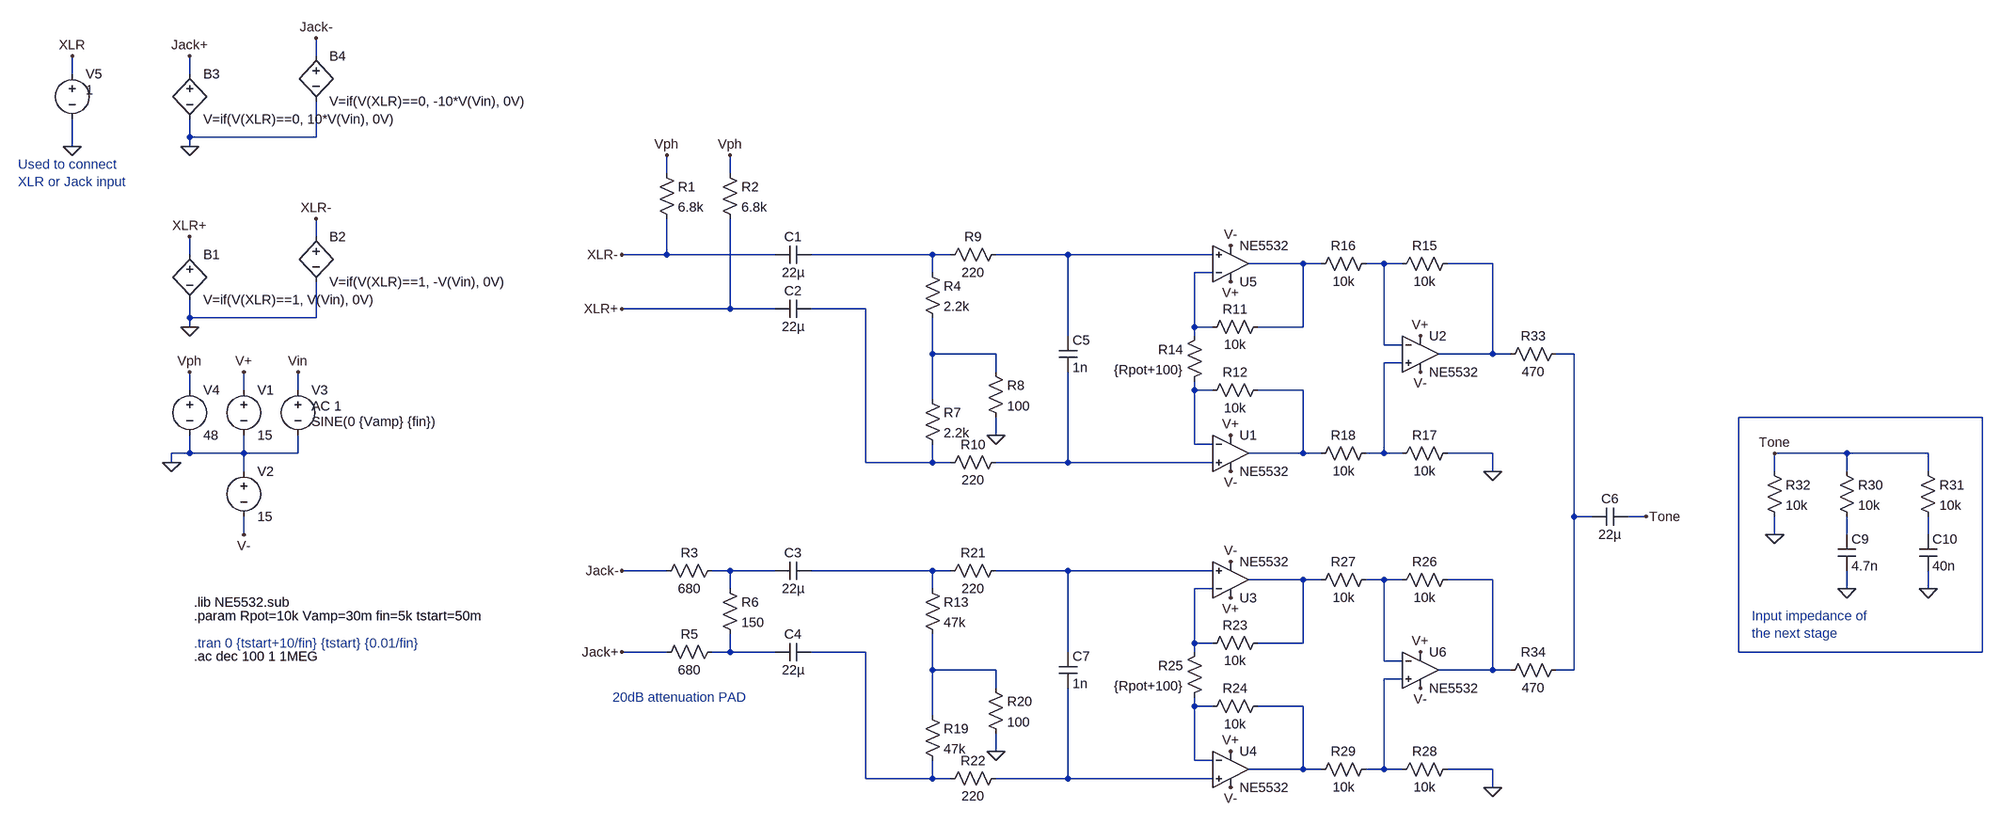
[diagram p0: schematic AudioMixer - Mic-Line-amp.asc]
AudioMixer - Mic-Line-amp.asc, the LTspice schematic file:
Version 4.1
SHEET 1 3588 2084
WIRE -704 -576 -704 -608
WIRE -1136 -544 -1136 -576
WIRE -928 -544 -928 -576
WIRE -928 -432 -928 -464
WIRE -704 -432 -704 -496
WIRE -704 -432 -928 -432
WIRE -1136 -416 -1136 -464
WIRE -928 -416 -928 -432
WIRE 544 -368 544 -400
WIRE 656 -368 656 -400
WIRE -704 -256 -704 -288
WIRE -928 -224 -928 -256
WIRE 544 -224 544 -288
WIRE 544 -224 464 -224
WIRE 736 -224 544 -224
WIRE 1040 -224 800 -224
WIRE 1072 -224 1040 -224
WIRE 1280 -224 1152 -224
WIRE 1536 -224 1280 -224
WIRE 1696 -208 1600 -208
WIRE 1728 -208 1696 -208
WIRE 1840 -208 1808 -208
WIRE 1872 -208 1840 -208
WIRE 2032 -208 1952 -208
WIRE 1040 -192 1040 -224
WIRE 1536 -192 1504 -192
WIRE 656 -128 656 -288
WIRE 656 -128 464 -128
WIRE 736 -128 656 -128
WIRE 896 -128 800 -128
WIRE -928 -112 -928 -144
WIRE -704 -112 -704 -176
WIRE -704 -112 -928 -112
WIRE -928 -96 -928 -112
WIRE 1504 -96 1504 -192
WIRE 1536 -96 1504 -96
WIRE 1696 -96 1696 -208
WIRE 1696 -96 1616 -96
WIRE 1280 -80 1280 -224
WIRE 1504 -80 1504 -96
WIRE 1840 -64 1840 -208
WIRE 1872 -64 1840 -64
WIRE 1040 -48 1040 -112
WIRE 1152 -48 1040 -48
WIRE 2032 -48 2032 -208
WIRE 2032 -48 1936 -48
WIRE 2064 -48 2032 -48
WIRE 2176 -48 2144 -48
WIRE 1872 -32 1840 -32
WIRE 1152 -16 1152 -48
WIRE -928 16 -928 -16
WIRE -832 16 -832 -16
WIRE -736 16 -736 -16
WIRE 1504 16 1504 0
WIRE 1536 16 1504 16
WIRE 1696 16 1616 16
WIRE 1040 32 1040 -48
WIRE 2928 64 2496 64
WIRE 1152 96 1152 64
WIRE 1504 112 1504 16
WIRE 1536 112 1504 112
WIRE -928 128 -928 96
WIRE -928 128 -960 128
WIRE -832 128 -832 96
WIRE -832 128 -928 128
WIRE -736 128 -736 96
WIRE -736 128 -832 128
WIRE 1696 128 1696 16
WIRE 1696 128 1600 128
WIRE 1728 128 1696 128
WIRE 1840 128 1840 -32
WIRE 1840 128 1808 128
WIRE 1872 128 1840 128
WIRE 2032 128 1952 128
WIRE 2688 128 2560 128
WIRE 2832 128 2688 128
WIRE -960 144 -960 128
WIRE 896 144 896 -128
WIRE 1040 144 1040 112
WIRE 1040 144 896 144
WIRE 1072 144 1040 144
WIRE 1280 144 1280 -16
WIRE 1280 144 1152 144
WIRE 1536 144 1280 144
WIRE -832 160 -832 128
WIRE 2032 160 2032 128
WIRE 2560 160 2560 128
WIRE 2688 160 2688 128
WIRE 2832 160 2832 128
WIRE 2176 240 2176 -48
WIRE 2208 240 2176 240
WIRE 2304 240 2272 240
WIRE -832 272 -832 240
WIRE 2560 272 2560 240
WIRE 2688 272 2688 240
WIRE 2832 272 2832 240
WIRE 544 336 464 336
WIRE 656 336 624 336
WIRE 736 336 656 336
WIRE 1040 336 800 336
WIRE 1072 336 1040 336
WIRE 1280 336 1152 336
WIRE 1536 336 1280 336
WIRE 1696 352 1600 352
WIRE 1728 352 1696 352
WIRE 1840 352 1808 352
WIRE 1872 352 1840 352
WIRE 2032 352 1952 352
WIRE 656 368 656 336
WIRE 1040 368 1040 336
WIRE 1536 368 1504 368
WIRE 2688 368 2688 336
WIRE 2832 368 2832 336
WIRE 1504 464 1504 368
WIRE 1536 464 1504 464
WIRE 1696 464 1696 352
WIRE 1696 464 1616 464
WIRE 544 480 464 480
WIRE 656 480 656 448
WIRE 656 480 624 480
WIRE 736 480 656 480
WIRE 896 480 800 480
WIRE 1280 480 1280 336
WIRE 1504 480 1504 464
WIRE 2496 480 2496 64
WIRE 2928 480 2928 64
WIRE 2928 480 2496 480
WIRE 1840 496 1840 352
WIRE 1872 496 1840 496
WIRE 1040 512 1040 448
WIRE 1152 512 1040 512
WIRE 2032 512 2032 352
WIRE 2032 512 1936 512
WIRE 2064 512 2032 512
WIRE 2176 512 2176 240
WIRE 2176 512 2144 512
WIRE 1872 528 1840 528
WIRE 1152 544 1152 512
WIRE 1504 576 1504 560
WIRE 1536 576 1504 576
WIRE 1696 576 1616 576
WIRE 1040 592 1040 512
WIRE 1152 656 1152 624
WIRE 1504 672 1504 576
WIRE 1536 672 1504 672
WIRE 1696 688 1696 576
WIRE 1696 688 1600 688
WIRE 1728 688 1696 688
WIRE 1840 688 1840 528
WIRE 1840 688 1808 688
WIRE 1872 688 1840 688
WIRE 2032 688 1952 688
WIRE 896 704 896 480
WIRE 1040 704 1040 672
WIRE 1040 704 896 704
WIRE 1072 704 1040 704
WIRE 1280 704 1280 544
WIRE 1280 704 1152 704
WIRE 1536 704 1280 704
WIRE 2032 720 2032 688
FLAG -960 144 0
FLAG -832 -16 V+
FLAG -832 272 V-
FLAG -736 -16 Vin
FLAG 1568 -176 V+
FLAG 1568 -240 V-
FLAG -928 -96 0
FLAG -928 -256 XLR+
FLAG -704 -288 XLR-
FLAG -928 -416 0
FLAG -928 -576 Jack+
FLAG -704 -608 Jack-
FLAG -928 -16 Vph
FLAG 544 -400 Vph
FLAG 656 -400 Vph
FLAG 464 -224 XLR-
FLAG 464 -128 XLR+
FLAG 464 336 Jack-
FLAG 464 480 Jack+
FLAG 1152 96 0
FLAG 1568 96 V+
FLAG 1568 160 V-
FLAG 1904 -80 V+
FLAG 1904 -16 V-
FLAG 2032 160 0
FLAG -1136 -576 XLR
FLAG -1136 -416 0
FLAG 2560 128 Tone
FLAG 2560 272 0
FLAG 1568 384 V+
FLAG 1568 320 V-
FLAG 1152 656 0
FLAG 1568 656 V+
FLAG 1568 720 V-
FLAG 1904 480 V+
FLAG 1904 544 V-
FLAG 2032 720 0
FLAG 2688 368 0
FLAG 2832 368 0
FLAG 2304 240 Tone
SYMBOL voltage -832 0 R0
SYMATTR InstName V1
SYMATTR Value 15
SYMBOL voltage -832 144 R0
SYMATTR InstName V2
SYMATTR Value 15
SYMBOL voltage -736 0 R0
WINDOW 123 24 44 Left 2
WINDOW 39 0 0 Left 0
WINDOW 3 24 72 Left 2
SYMATTR Value2 AC 1
SYMATTR Value SINE(0 {Vamp} {fin})
SYMATTR InstName V3
SYMBOL OpAmps\\opamp2 1568 -144 M180
SYMATTR InstName U5
SYMATTR Value NE5532
SYMBOL bv -928 -240 R0
SYMATTR InstName B1
SYMATTR Value V=if(V(XLR)==1, V(Vin), 0V)
SYMBOL bv -704 -272 R0
SYMATTR InstName B2
SYMATTR Value V=if(V(XLR)==1, -V(Vin), 0V)
SYMBOL bv -928 -560 R0
SYMATTR InstName B3
SYMATTR Value V=if(V(XLR)==0, 10*V(Vin), 0V)
SYMBOL bv -704 -592 R0
SYMATTR InstName B4
SYMATTR Value V=if(V(XLR)==0, -10*V(Vin), 0V)
SYMBOL res 528 -384 R0
SYMATTR InstName R1
SYMATTR Value 6.8k
SYMBOL res 640 -384 R0
SYMATTR InstName R2
SYMATTR Value 6.8k
SYMBOL voltage -928 0 R0
SYMATTR InstName V4
SYMATTR Value 48
SYMBOL cap 800 -240 R90
WINDOW 0 0 32 VBottom 2
WINDOW 3 32 32 VTop 2
SYMATTR InstName C1
SYMATTR Value 22µ
SYMBOL cap 800 -144 R90
WINDOW 0 0 32 VBottom 2
WINDOW 3 32 32 VTop 2
SYMATTR InstName C2
SYMATTR Value 22µ
SYMBOL res 640 320 R90
WINDOW 0 0 56 VBottom 2
WINDOW 3 32 56 VTop 2
SYMATTR InstName R3
SYMATTR Value 680
SYMBOL res 640 464 R90
WINDOW 0 0 56 VBottom 2
WINDOW 3 32 56 VTop 2
SYMATTR InstName R5
SYMATTR Value 680
SYMBOL res 640 352 R0
SYMATTR InstName R6
SYMATTR Value 150
SYMBOL res 1024 -208 R0
SYMATTR InstName R4
SYMATTR Value 2.2k
SYMBOL res 1024 16 R0
SYMATTR InstName R7
SYMATTR Value 2.2k
SYMBOL res 1136 -32 R0
SYMATTR InstName R8
SYMATTR Value 100
SYMBOL res 1168 -240 R90
WINDOW 0 0 56 VBottom 2
WINDOW 3 32 56 VTop 2
SYMATTR InstName R9
SYMATTR Value 220
SYMBOL res 1168 128 R90
WINDOW 0 0 56 VBottom 2
WINDOW 3 32 56 VTop 2
SYMATTR InstName R10
SYMATTR Value 220
SYMBOL cap 1264 -80 R0
SYMATTR InstName C5
SYMATTR Value 1n
SYMBOL OpAmps\\opamp2 1568 64 R0
SYMATTR InstName U1
SYMATTR Value NE5532
SYMBOL res 1632 -112 R90
WINDOW 0 0 56 VBottom 2
WINDOW 3 32 56 VTop 2
SYMATTR InstName R11
SYMATTR Value 10k
SYMBOL res 1632 0 R90
WINDOW 0 0 56 VBottom 2
WINDOW 3 32 56 VTop 2
SYMATTR InstName R12
SYMATTR Value 10k
SYMBOL res 1520 -96 M0
SYMATTR InstName R14
SYMATTR Value {Rpot+100}
SYMBOL OpAmps\\opamp2 1904 -112 R0
SYMATTR InstName U2
SYMATTR Value NE5532
SYMBOL res 1968 -224 R90
WINDOW 0 0 56 VBottom 2
WINDOW 3 32 56 VTop 2
SYMATTR InstName R15
SYMATTR Value 10k
SYMBOL res 1712 -192 R270
WINDOW 0 32 56 VTop 2
WINDOW 3 0 56 VBottom 2
SYMATTR InstName R16
SYMATTR Value 10k
SYMBOL res 1968 112 R90
WINDOW 0 0 56 VBottom 2
WINDOW 3 32 56 VTop 2
SYMATTR InstName R17
SYMATTR Value 10k
SYMBOL res 1712 144 R270
WINDOW 0 32 56 VTop 2
WINDOW 3 0 56 VBottom 2
SYMATTR InstName R18
SYMATTR Value 10k
SYMBOL voltage -1136 -560 R0
WINDOW 123 24 124 Left 2
WINDOW 39 0 0 Left 0
WINDOW 3 24 44 Left 2
SYMATTR Value 1
SYMATTR InstName V5
SYMBOL OpAmps\\opamp2 1568 416 M180
SYMATTR InstName U3
SYMATTR Value NE5532
SYMBOL cap 800 320 R90
WINDOW 0 0 32 VBottom 2
WINDOW 3 32 32 VTop 2
SYMATTR InstName C3
SYMATTR Value 22µ
SYMBOL cap 800 464 R90
WINDOW 0 0 32 VBottom 2
WINDOW 3 32 32 VTop 2
SYMATTR InstName C4
SYMATTR Value 22µ
SYMBOL res 1024 352 R0
SYMATTR InstName R13
SYMATTR Value 47k
SYMBOL res 1024 576 R0
SYMATTR InstName R19
SYMATTR Value 47k
SYMBOL res 1136 528 R0
SYMATTR InstName R20
SYMATTR Value 100
SYMBOL res 1168 320 R90
WINDOW 0 0 56 VBottom 2
WINDOW 3 32 56 VTop 2
SYMATTR InstName R21
SYMATTR Value 220
SYMBOL res 1168 688 R90
WINDOW 0 0 56 VBottom 2
WINDOW 3 32 56 VTop 2
SYMATTR InstName R22
SYMATTR Value 220
SYMBOL cap 1264 480 R0
SYMATTR InstName C7
SYMATTR Value 1n
SYMBOL OpAmps\\opamp2 1568 624 R0
SYMATTR InstName U4
SYMATTR Value NE5532
SYMBOL res 1632 448 R90
WINDOW 0 0 56 VBottom 2
WINDOW 3 32 56 VTop 2
SYMATTR InstName R23
SYMATTR Value 10k
SYMBOL res 1632 560 R90
WINDOW 0 0 56 VBottom 2
WINDOW 3 32 56 VTop 2
SYMATTR InstName R24
SYMATTR Value 10k
SYMBOL res 1520 464 M0
SYMATTR InstName R25
SYMATTR Value {Rpot+100}
SYMBOL OpAmps\\opamp2 1904 448 R0
SYMATTR InstName U6
SYMATTR Value NE5532
SYMBOL res 1968 336 R90
WINDOW 0 0 56 VBottom 2
WINDOW 3 32 56 VTop 2
SYMATTR InstName R26
SYMATTR Value 10k
SYMBOL res 1712 368 R270
WINDOW 0 32 56 VTop 2
WINDOW 3 0 56 VBottom 2
SYMATTR InstName R27
SYMATTR Value 10k
SYMBOL res 1968 672 R90
WINDOW 0 0 56 VBottom 2
WINDOW 3 32 56 VTop 2
SYMATTR InstName R28
SYMATTR Value 10k
SYMBOL res 1712 704 R270
WINDOW 0 32 56 VTop 2
WINDOW 3 0 56 VBottom 2
SYMATTR InstName R29
SYMATTR Value 10k
SYMBOL res 2672 144 R0
SYMATTR InstName R30
SYMATTR Value 10k
SYMBOL res 2816 144 R0
SYMATTR InstName R31
SYMATTR Value 10k
SYMBOL cap 2672 272 R0
SYMATTR InstName C9
SYMATTR Value 4.7n
SYMBOL cap 2816 272 R0
SYMATTR InstName C10
SYMATTR Value 40n
SYMBOL res 2544 144 R0
SYMATTR InstName R32
SYMATTR Value 10k
SYMBOL res 2160 -64 R90
WINDOW 0 0 56 VBottom 2
WINDOW 3 32 56 VTop 2
SYMATTR InstName R33
SYMATTR Value 470
SYMBOL res 2160 496 R90
WINDOW 0 0 56 VBottom 2
WINDOW 3 32 56 VTop 2
SYMATTR InstName R34
SYMATTR Value 470
SYMBOL cap 2272 224 R90
WINDOW 0 0 32 VBottom 2
WINDOW 3 32 32 VTop 2
SYMATTR InstName C6
SYMATTR Value 22µ
TEXT -920 416 Left 2 !.param Rpot=10k Vamp=30m fin=5k tstart=50m
TEXT -920 392 Left 2 !.lib NE5532.sub
TEXT -920 464 Left 2 ;.tran 0 {tstart+10/fin} {tstart} {0.01/fin}
TEXT 448 560 Left 2 ;20dB attenuation PAD
TEXT -1232 -384 Left 2 ;Used to connect\nXLR or Jack input
TEXT 2520 416 Left 2 ;Input impedance of\nthe next stage
TEXT -920 488 Left 2 !.ac dec 100 1 1MEG

The netlist it stands for:
* AudioMixer - Mic-Line-amp.asc
V1 V+ 0 15
V2 0 V- 15
V3 Vin 0 SINE(0 {Vamp} {fin}) AC 1
X§U5 N002 N006 V+ V- N003 NE5532  ; pins In+ In- V+ V- OUT
B1 XLR+ 0 V=if(V(XLR)==1, V(Vin), 0V)
B2 XLR- 0 V=if(V(XLR)==1, -V(Vin), 0V)
B3 Jack+ 0 V=if(V(XLR)==0, 10*V(Vin), 0V)
B4 Jack- 0 V=if(V(XLR)==0, -10*V(Vin), 0V)
R1 Vph XLR- 6.8k
R2 Vph XLR+ 6.8k
V4 Vph 0 48
C1 N001 XLR- 22µ
C2 N007 XLR+ 22µ
R3 N017 Jack- 680
R5 N024 Jack+ 680
R6 N017 N024 150
R4 N001 N008 2.2k
R7 N008 N007 2.2k
R8 N008 0 100
R9 N002 N001 220
R10 N014 N007 220
C5 N002 N014 1n
X§U1 N014 N011 V+ V- N012 NE5532  ; pins In+ In- V+ V- OUT
R11 N003 N006 10k
R12 N012 N011 10k
R14 N006 N011 {Rpot+100}
X§U2 N010 N004 V+ V- N005 NE5532  ; pins In+ In- V+ V- OUT
R15 N005 N004 10k
R16 N003 N004 10k
R17 0 N010 10k
R18 N012 N010 10k
V5 XLR 0 1
X§U3 N019 N023 V+ V- N020 NE5532  ; pins In+ In- V+ V- OUT
C3 N018 N017 22µ
C4 N025 N024 22µ
R13 N018 N026 47k
R19 N026 N025 47k
R20 N026 0 100
R21 N019 N018 220
R22 N030 N025 220
C7 N019 N030 1n
X§U4 N030 N028 V+ V- N029 NE5532  ; pins In+ In- V+ V- OUT
R23 N020 N023 10k
R24 N029 N028 10k
R25 N023 N028 {Rpot+100}
X§U6 N027 N021 V+ V- N022 NE5532  ; pins In+ In- V+ V- OUT
R26 N022 N021 10k
R27 N020 N021 10k
R28 0 N027 10k
R29 N029 N027 10k
R30 Tone N015 10k
R31 Tone N016 10k
C9 N015 0 4.7n
C10 N016 0 40n
R32 Tone 0 10k
R33 N009 N005 470
R34 N009 N022 470
C6 Tone N009 22µ
.param Rpot=10k Vamp=30m fin=5k tstart=50m
.lib NE5532.sub
* .tran 0 {tstart+10/fin} {tstart} {0.01/fin}
* 20dB attenuation PAD
* Used to connect
* XLR or Jack input
* Input impedance of
* the next stage
.ac dec 100 1 1MEG
.backanno
.end